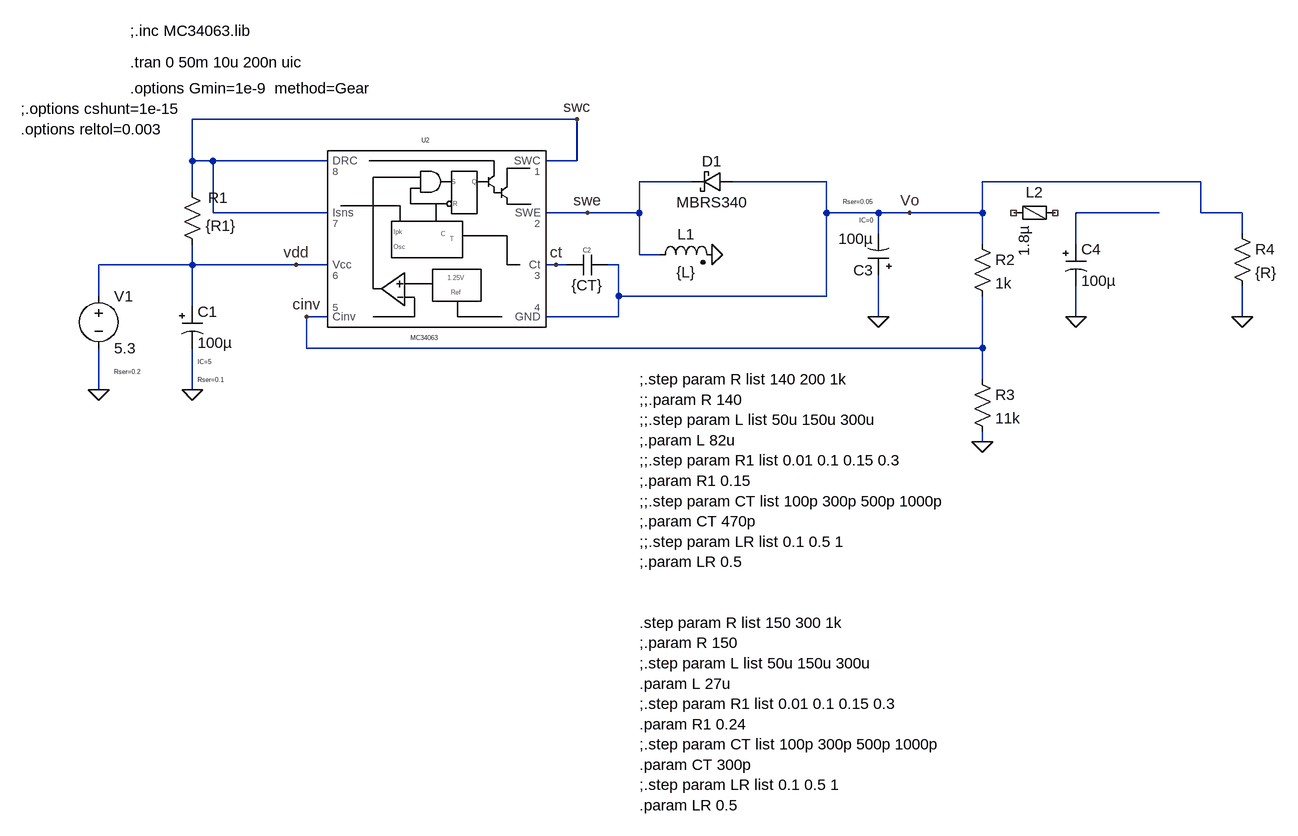
[diagram p0: schematic MC34063_invert.asc]
MC34063_invert.asc, the LTspice schematic file:
Version 4
SHEET 1 1980 1068
WIRE 320 64 -272 64
WIRE -272 128 -272 64
WIRE -240 128 -272 128
WIRE -64 128 -240 128
WIRE 320 128 320 64
WIRE 320 128 272 128
WIRE 496 160 416 160
WIRE 704 160 560 160
WIRE 1280 160 944 160
WIRE -272 176 -272 128
WIRE -240 208 -240 128
WIRE -64 208 -240 208
WIRE 336 208 272 208
WIRE 416 208 416 160
WIRE 416 208 336 208
WIRE 704 208 704 160
WIRE 784 208 704 208
WIRE 832 208 784 208
WIRE 944 208 944 160
WIRE 944 208 832 208
WIRE 1216 208 1088 208
WIRE 1280 208 1280 160
WIRE 1344 208 1280 208
WIRE 784 240 784 208
WIRE 1344 240 1344 208
WIRE 944 256 944 208
WIRE 1088 256 1088 208
WIRE 416 272 416 208
WIRE 448 272 416 272
WIRE -272 288 -272 256
WIRE -272 288 -416 288
WIRE -112 288 -272 288
WIRE -64 288 -112 288
WIRE 288 288 272 288
WIRE 304 288 288 288
WIRE 384 288 368 288
WIRE -416 336 -416 288
WIRE 384 336 384 288
WIRE 704 336 704 208
WIRE 704 336 384 336
WIRE -272 352 -272 288
WIRE -64 368 -96 368
WIRE 384 368 384 336
WIRE 384 368 272 368
WIRE 784 368 784 304
WIRE 1088 368 1088 320
WIRE 1344 368 1344 320
WIRE -96 416 -96 368
WIRE 944 416 944 336
WIRE 944 416 -96 416
WIRE 944 464 944 416
WIRE -416 480 -416 416
WIRE -272 480 -272 416
WIRE 944 560 944 544
FLAG -416 480 0
FLAG -272 480 0
FLAG 784 368 0
FLAG 832 208 Vo
FLAG 944 560 0
FLAG 1088 368 0
FLAG 288 288 ct
FLAG 336 208 swe
FLAG -112 288 vdd
FLAG -96 368 cinv
FLAG 1344 368 0
FLAG 320 64 swc
FLAG 528 272 0
SYMBOL voltage -416 320 R0
WINDOW 123 0 0 Left 0
WINDOW 39 24 132 Left 0
SYMATTR SpiceLine Rser=0.2
SYMATTR InstName V1
SYMATTR Value 5.3
SYMBOL res -256 272 R180
WINDOW 0 -39 87 Left 2
WINDOW 3 -52 44 Left 2
SYMATTR InstName R1
SYMATTR Value {R1}
SYMBOL cap 304 304 R270
WINDOW 0 32 32 VTop 0
WINDOW 3 0 32 VBottom 2
SYMATTR InstName C2
SYMATTR Value {CT}
SYMBOL schottky 560 144 R90
WINDOW 0 0 32 VBottom 2
WINDOW 3 32 32 VTop 2
SYMATTR InstName D1
SYMATTR Value MBRS340
SYMATTR Description Diode
SYMATTR Type diode
SYMBOL ind2 432 288 R270
WINDOW 0 32 56 VTop 2
WINDOW 3 4 56 VBottom 2
SYMATTR InstName L1
SYMATTR Value {L}
SYMATTR SpiceLine Rser={LR}
SYMATTR Type ind
SYMBOL res 928 240 R0
SYMATTR InstName R2
SYMATTR Value 1k
SYMBOL res 928 448 R0
SYMATTR InstName R3
SYMATTR Value 11k
SYMBOL res 1328 224 R0
SYMATTR InstName R4
SYMATTR Value {R}
SYMBOL polcap 800 304 R180
WINDOW 39 24 113 Left 0
WINDOW 40 24 85 Left 0
SYMATTR SpiceLine Rser=0.05
SYMATTR SpiceLine2 IC=0
SYMATTR InstName C3
SYMATTR Value 100µ
SYMBOL polcap -288 352 R0
WINDOW 39 24 113 Left 0
WINDOW 40 24 85 Left 0
SYMATTR SpiceLine Rser=0.1
SYMATTR SpiceLine2 IC=5
SYMATTR InstName C1
SYMATTR Value 100µ
SYMBOL polcap 1072 256 R0
WINDOW 3 24 56 Left 2
SYMATTR Value 100µ
SYMATTR InstName C4
SYMATTR Description Capacitor
SYMATTR Type cap
SYMATTR SpiceLine V=25 Irms=370m Rser=0.024 Lser=0
SYMBOL FerriteBead 1024 208 R90
WINDOW 0 -16 0 VBottom 2
SYMATTR InstName L2
SYMATTR Value 1.8µ
SYMATTR SpiceLine Ipk=2.5 Rser=0.07 Rpar=620 Cpar=1.9p mfg="Würth Elektronik" pn="742792118 WE-CBF 1206"
SYMBOL MC34063 176 224 R0
SYMATTR InstName U2
TEXT -368 -24 Left 2 !.tran 0 50m 10u 200n uic
TEXT -368 -72 Left 2 !;.inc MC34063.lib
TEXT -368 16 Left 2 !.options Gmin=1e-9  method=Gear
TEXT 416 464 Left 2 !;.step param R list 140 200 1k\n;;.param R 140\n;;.step param L list 50u 150u 300u\n;.param L 82u\n;;.step param R1 list 0.01 0.1 0.15 0.3\n;.param R1 0.15\n;;.step param CT list 100p 300p 500p 1000p\n;.param CT 470p\n;;.step param LR list 0.1 0.5 1\n;.param LR 0.5\n \n \n.step param R list 150 300 1k\n;.param R 150\n;.step param L list 50u 150u 300u\n.param L 27u\n;.step param R1 list 0.01 0.1 0.15 0.3\n.param R1 0.24\n;.step param CT list 100p 300p 500p 1000p\n.param CT 300p\n;.step param LR list 0.1 0.5 1\n.param LR 0.5
TEXT -536 48 Left 2 !;.options cshunt=1e-15\n.options reltol=0.003

The netlist it stands for:
* MC34063_invert.asc
V1 vdd 0 5.3 Rser=0.2
R1 vdd swc {R1}
C2 ct Vo {CT}
D1 Vo swe MBRS340
L1 swe 0 {L} Rser={LR}
R2 Vo cinv 1k
R3 cinv 0 11k
R4 Vo 0 {R}
C3 0 Vo 100µ Rser=0.05 IC=0
C1 vdd 0 100µ Rser=0.1 IC=5
C4 N001 0 100µ V=25 Irms=370m Rser=0.024 Lser=0
L2 NC_01 NC_02 1.8µ Ipk=2.5 Rser=0.07 Rpar=620 Cpar=1.9p mfg="Würth Elektronik" pn="742792118 WE-CBF 1206"
XU2 swc swe ct Vo cinv vdd swc swc MC34063  ; pins SWC SWE Ct GND Cinv Vcc Isns DRC
.model D D
.lib standard.dio
.tran 0 50m 10u 200n uic
;.inc MC34063.lib
.options Gmin=1e-9  method=Gear
;.step param R list 140 200 1k
;;.param R 140
;;.step param L list 50u 150u 300u
;.param L 82u
;;.step param R1 list 0.01 0.1 0.15 0.3
;.param R1 0.15
;;.step param CT list 100p 300p 500p 1000p
;.param CT 470p
;;.step param LR list 0.1 0.5 1
;.param LR 0.5
.step param R list 150 300 1k
;.param R 150
;.step param L list 50u 150u 300u
.param L 27u
;.step param R1 list 0.01 0.1 0.15 0.3
.param R1 0.24
;.step param CT list 100p 300p 500p 1000p
.param CT 300p
;.step param LR list 0.1 0.5 1
.param LR 0.5
;.options cshunt=1e-15
.options reltol=0.003
.lib MC34063.lib
.backanno
.end